# Altium project CANSAT_PCB_COMM.PrjPcb
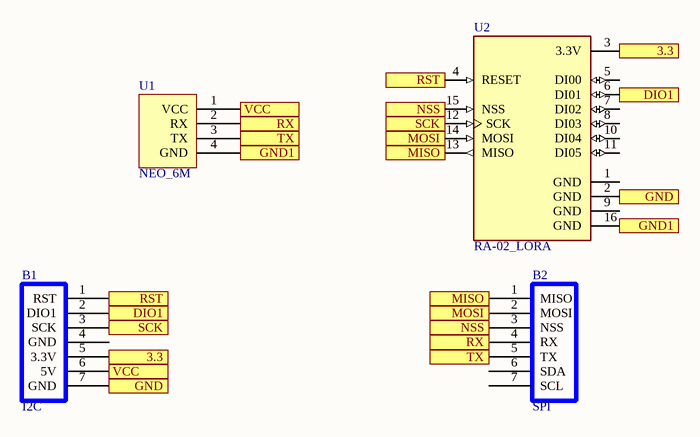
[diagram p0: SCHEMATIC_COMM.SchDoc]
1 sheet, 4 parts. Net scope: flat (ports and power ports of the same name join across sheets).
Board file: PCB_COMM.PcbDoc

## Sheet SCHEMATIC_COMM.SchDoc
size A4

### Parts
B1  I2C  [bus left]
B2  SPI  [bus right]
U1  NEO_6M  [NEO_6M]
U2  RA-02_LORA  [MODULE_RA-02_LORA]

### Ports
3.3, DIO1, GND, GND1, MISO, MOSI, NSS, RST, RX, SCK, TX, VCC

### Nets
NetB1_1: B1.1(RST) U2.4(RESET) ; port RST
NetB1_2: B1.2(DIO1) U2.6(DI01) ; port DIO1
NetB1_3: B1.3(SCK) U2.12(SCK) ; port SCK
NetB1_5: B1.5(3.3V) U2.3(3.3V) ; port 3.3
NetB1_6: B1.6(5V) U1.1(VCC) ; port VCC
NetB1_7: B1.7(GND) U2.2(GND) ; port GND
NetB2_1: B2.1(MISO) U2.13(MISO) ; port MISO
NetB2_2: B2.2(MOSI) U2.14(MOSI) ; port MOSI
NetB2_3: B2.3(NSS) U2.15(NSS) ; port NSS
NetB2_4: B2.4(RX) U1.2(RX) ; port RX
NetB2_5: B2.5(TX) U1.3(TX) ; port TX
NetU1_4: U1.4(GND) U2.16(GND) ; port GND1

Not connected (* = marked no-connect by the designer): B1 4(GND); B2 6(SDA) 7(SCL); U2 1(GND) 5(DI00) 7(DI02) 8(DI03) 9(GND) 10(DI04) 11(DI05)

### Library data of the parts
B1 = BUS left
B2 = BUS right
U2 = RA-02_LORA: Ra-02 LoRa RF M5Stack Platform Evaluation Expansion Board; MF: AI-Thinker; SnapEDA_Link: https://www.snapeda.com/parts/Ra-02%20LoRa/AI-Thinker/view-part/?ref=snap; Package: None; Value: *; MP: Ra-02 LoRa; Check_prices: https://www.snapeda.com/parts/Ra-02%20LoRa/AI-Thinker/view-part/?ref=eda